# EasyEDA Pro project P3+KG.epro, schematic Schematic3
Board Name: 电源; Create Date: 2026-06-06; Page Name: P1; Project Name: P3; Schematic Name: Schematic3; Update Date: 2026-06-06; Company: 嘉立创EDA; Page Size: A4; Version: V1.0
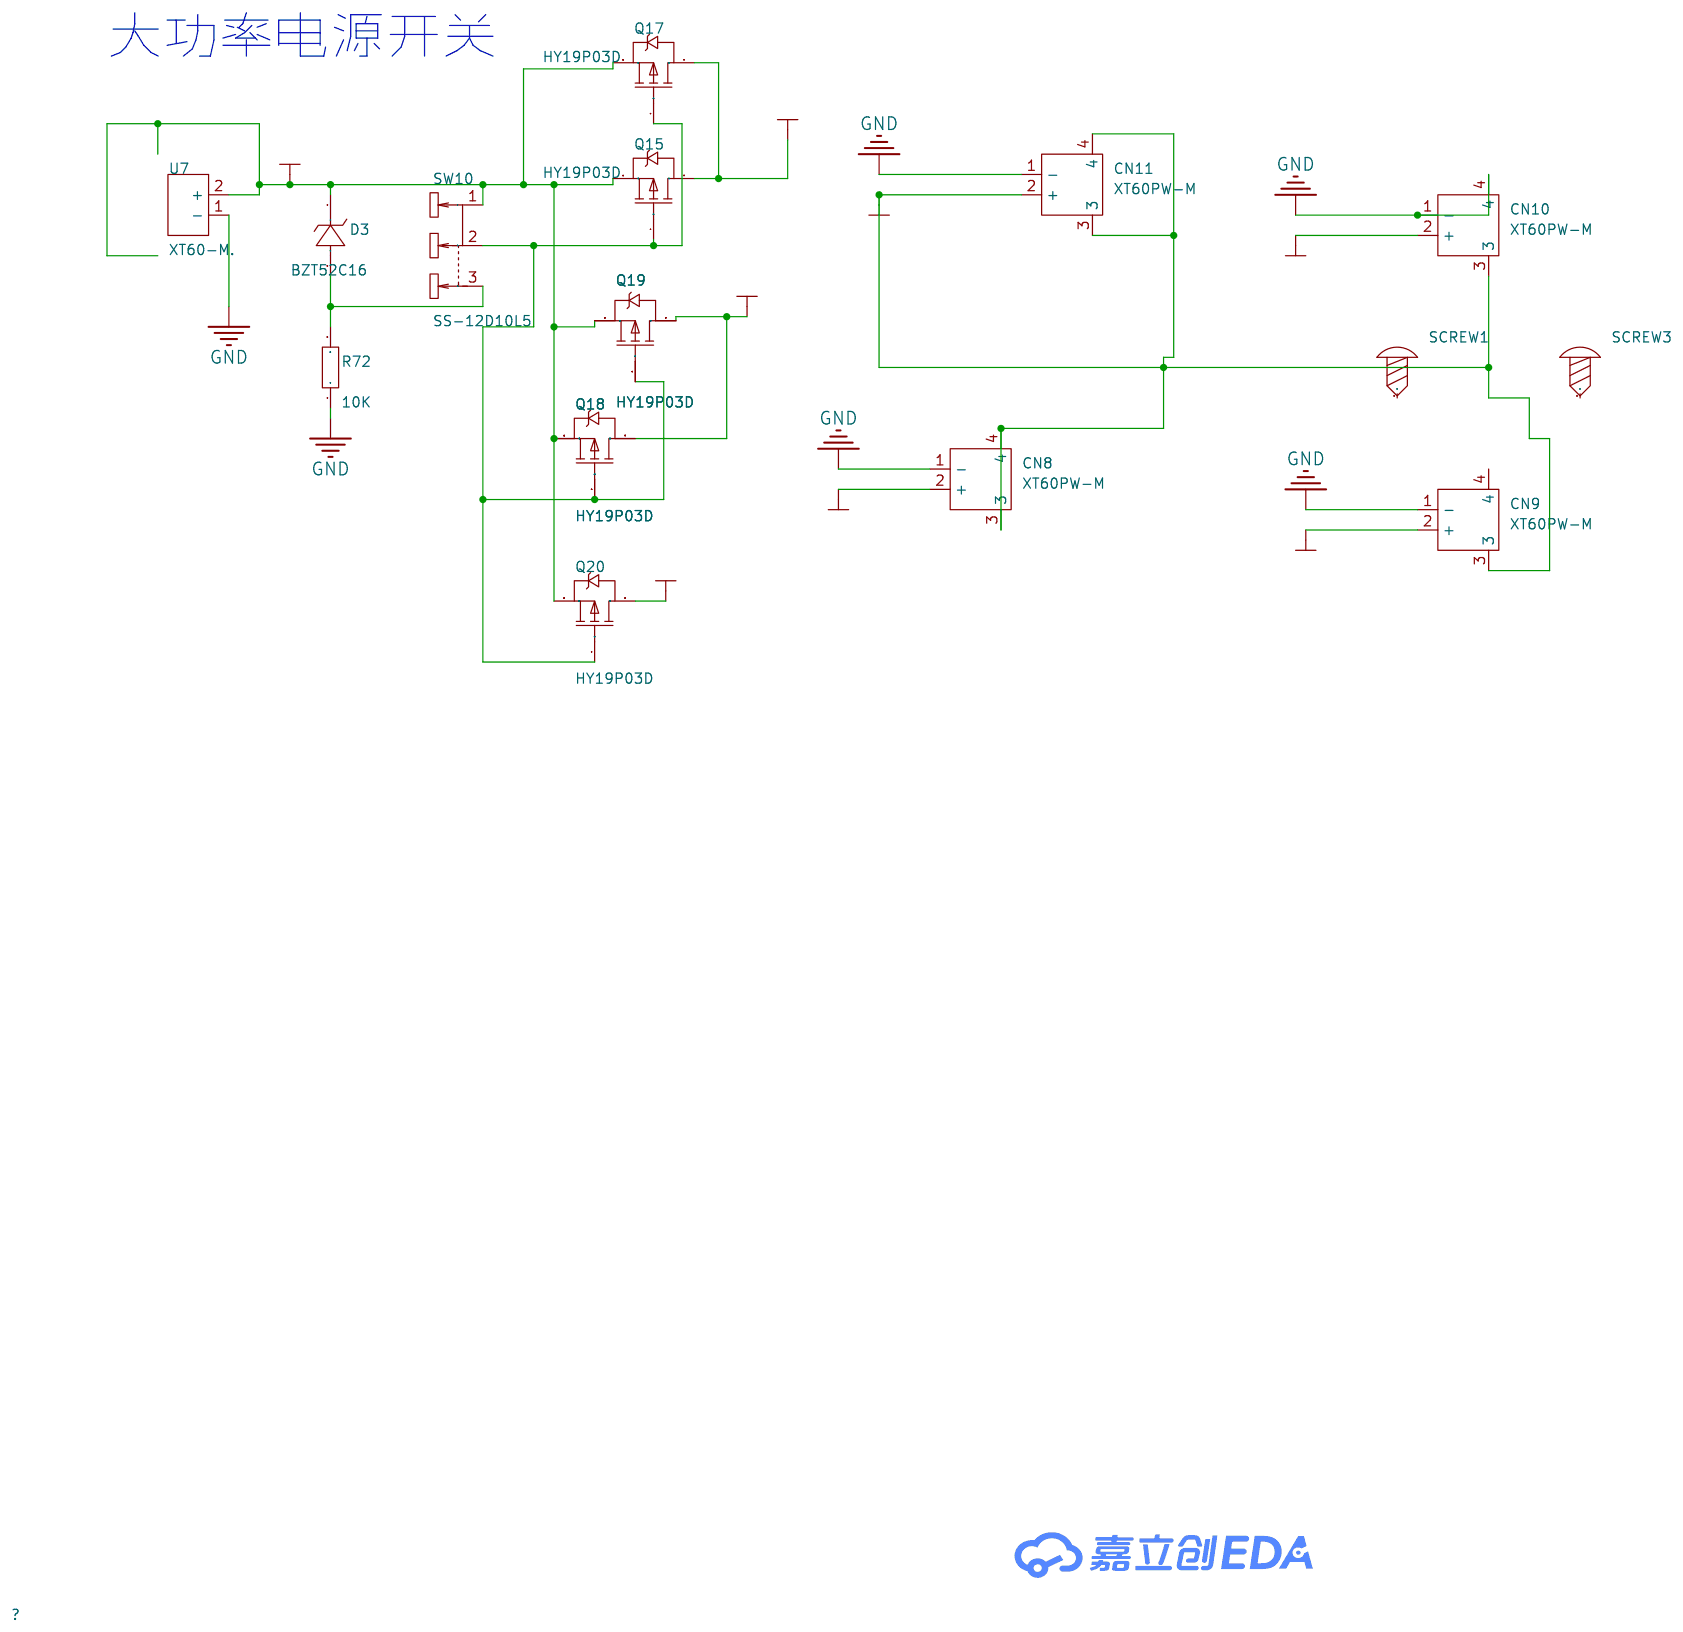
[diagram p5: schematic sheet]

## Parts
CN8  XT60PW-M  [CONN-TH_XT60PW-M]
CN9  XT60PW-M  [CONN-TH_XT60PW-M]
CN10  XT60PW-M  [CONN-TH_XT60PW-M]
CN11  XT60PW-M  [CONN-TH_XT60PW-M]
D3  BZT52C16  [SOD-123_L2.7-W1.6-LS3.7-RD]
Q15  HY19P03D  [TO-252-2_L6.6-W6.1-P4.57-LS9.9-TL-CW]
Q17  HY19P03D  [TO-252-2_L6.6-W6.1-P4.57-LS9.9-TL-CW]
Q18  HY19P03D  [TO-252-2_L6.6-W6.1-P4.57-LS9.9-TL-CW]
Q19  HY19P03D  [TO-252-2_L6.6-W6.1-P4.57-LS9.9-TL-CW]
Q20  HY19P03D  [TO-252-2_L6.6-W6.1-P4.57-LS9.9-TL-CW]
R72  10K  [R0805]
SCREW1  -  [M3螺丝]
SCREW3  -  [M3螺丝]
SW10  SS-12D10L5  [SW-TH_SS-12D10L5]
U7  XT60-M.  [CONN-TH_XT60]

## Library data of the parts
CN8-CN11 = XT60PW-M: 模型锂电连接器; LCSC Part Name: AMASS(艾迈斯)航模插头xt60连接器150公母对接pw锂电池公头 接PCB板卧式 黄色 公头XT60PW-M.G.Y; Supplier Part: C98732; Manufacturer: AMASS(艾迈斯); JLCPCB Part Class: 扩展库; Datasheet: https://item.szlcsc.com/datasheet/XT60PW-M/99942.html; Supplier: LCSC; colour: 黄色; Connector type: 卧式插头; interface form: 公头
D3 = BZT52C16_C19077413: 二极管配置:独立式;稳压值(标称值):16V;稳压值(范围):15.2V~16.8V;功率(Pd):500mW;; Supplier Part: C19077413; Manufacturer: 宏迦橙; Supplier Footprint: SOD-123; JLCPCB Part Class: 扩展库; Datasheet: https://atta.szlcsc.com/upload/public/pdf/source/20231117/6E01C14CCA1A38C68A5225952E4BCE14.pdf; Supplier: LCSC; Diode Configuration: 独立式; Zener Voltage (Nom): 16V; Reverse Leakage Current (Ir): 100nA@11.2V; Zener Voltage (Range): 15.2V~16.8V; Power Dissipation: 500mW; Zener Impedance (Zzt): 45Ω; Zener Voltage(Nom): 16V; Zener Voltage(Range): 15.2V~16.8V; Pd - Power Dissipation(Pd): 500mW; Impedance(Zzt): 45Ω
Q15 Q17-Q20 = HY19P03D: 类型:P沟道;漏源电压(Vdss):30V;连续漏极电流(Id):90A;功率(Pd):50W;导通电阻(RDS(on)@Vgs,Id):6mΩ@10V,45A;阈值电压(Vgs(th)@Id):3V@250uA;; LCSC Part Name: P沟道 耐压:30V 电流:90A; Supplier Part: C122492; Manufacturer: HUAYI(华羿微); Supplier Footprint: TO-252-2; JLCPCB Part Class: 扩展库; Datasheet: https://atta.szlcsc.com/upload/public/pdf/source/20170728/C122492_1501225751911848809.pdf; Supplier: LCSC; Type: P沟道; Drain Source Voltage (Vdss): 30V; Continuous Drain Current (Id): 90A; Power Dissipation (Pd): 50W; Drain Source On Resistance (RDS(on)@Vgs,Id): 6mΩ@10V,45A; Gate Threshold Voltage (Vgs(th)@Id): 3V@250uA
R72 = Res_0805: Supplier Footprint: 0805
SCREW1 SCREW3 = M3螺丝: Supplier Footprint: 插件
SW10 = SS-12D10L5: 电路结构:单刀双掷;安装方式:直插;开关颜色:黑色;额定电流:3A;额定电压:125V;工作寿命:1万次;; LCSC Part Name: 柄长5mm 直插双档 滑动开关; Supplier Part: C319012; Manufacturer: XKB Connection(中国星坤); Supplier Footprint: 插件,13x6.8mm; JLCPCB Part Class: 扩展库; Datasheet: https://item.szlcsc.com/datasheet/SS-12D10L5/300104.html; Supplier: LCSC; Circuit: 单刀双掷; Actuator Style: 矩形柱状; Termination Style: PC引脚; Length: 13mm; Width: 6.8mm; Switch Height: 6.4mm; Mounting Type: 直插; Actuator Color: 黑色; Current Rating: 3A; Voltage Rating: 125V; Life: 1万次; Operating Temperature: -40℃~+85℃; Pin Style: PC引脚; Switch Length: 13mm; Switch Width: 6.8mm; Mounting Style: 直插; Current Rating (DC): 3A; Voltage Rating (DC): 125V; Current Rating (AC): 3A; Voltage Rating (AC): 125V; Mechanical Life: 1万次
U7 = XT60-M.: 模型锂电连接器 XT60-M; LCSC Part Name: AMASS(艾迈斯)XT60模型插头出线焊接式  2P 镀金 公头XT60-M.G.Y; Supplier Part: C98733; Manufacturer: AMASS(艾迈斯); JLCPCB Part Class: 扩展库; Datasheet: https://item.szlcsc.com/datasheet/XT60-M./99943.html; Supplier: LCSC; colour: 黄色; Connector type: 香蕉头; Size/Specification: 3.5mm; interface form: 公头

## Nets
GND: CN8.1(-) CN9.1(-) CN10.1(-) CN10.4 CN11.1(-) R72.1 U7.1(-)
VCCB: CN8.2(+) CN8.3 CN8.4 CN9.2(+) CN9.3 CN10.2(+) CN10.3 CN11.2(+) CN11.3 CN11.4 Q15.2(D) Q17.2(D) Q18.2(D) Q19.2(D) Q20.2(D)
VM: D3.1(K) Q15.3(S) Q17.3(S) Q18.3(S) Q19.3(S) Q20.3(S) SW10.1 U7.2(+)
$1N554: Q15.1(G) Q17.1(G) Q18.1(G) Q19.1(G) Q20.1(G) SW10.2
$1N557: D3.2(A) R72.2 SW10.3

Not connected (* = marked no-connect by the designer): CN9 4; SCREW1 1; SCREW3 1

## Notes on the sheet
- 大功率电源开关
